# Altium schematic sheet Compute-Module-Sheet-2.SchDoc
size 420 x 297 mm; SheetNumber: 3; SheetTotal: 3
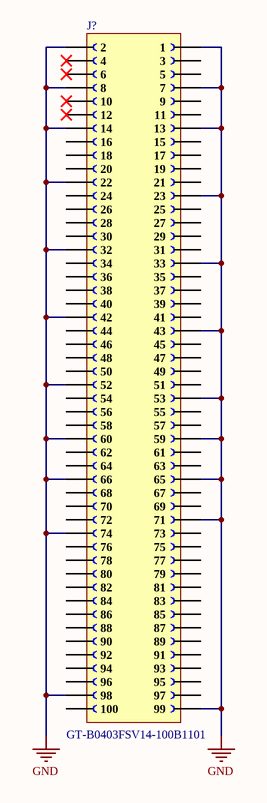
[diagram p0: Compute-Module-Sheet-2.SchDoc]

## Parts
J?  GT-B0403FSV14-100B1101  [GT-B0403FSV14-100B1101]

## Nets
GND: J?.1 J?.2 J?.7 J?.8 J?.13 J?.14 J?.22 J?.23 J?.32 J?.33 J?.42 J?.43 J?.52 J?.53 J?.59 J?.60 J?.65 J?.66 J?.71 J?.74 J?.98 J?.99

Not connected (* = marked no-connect by the designer): J? 3 4* 5 6* 9 10* 11 12* 15 16 17 18 19 20 21 24 25 26 27 28 29 30 31 34 35 36 37 38 39 40 41 44 45 46 47 48 49 50 51 54 55 56 57 58 61 62 63 64 67 68 69 70 72 73 75 76 77 78 79 80 81 82 83 84 85 86 87 88 89 90 91 92 93 94 95 96 97 100

## Notes on the sheet
- File:
- Title:
- Date:
- Page
- Num:
- Total:
- Drawn By: Huzaifa Ali

## Library data of the parts
J? = GT-B0403FSV14-100B1101: 0.4mm 2 100P -55℃~+125℃ Standing paste 0.3A SMD,P=0.4mm Board-to-Board and Backplane Connector ROHS; Manufacturer: G-Switch; Manufacturer Part Number: GT-B0403FSV14-100B1101; Package: SMD,P=0.4mm; LCSC Part Number: C42376244; Item Type: Connector; ComponentLink1Description: LCSC; ComponentLink1URL: https://www.lcsc.com/product-detail/Board-to-Board-and-Backplane-Connector_G-Switch-GT-B0403FSV14-100B1101_C42376244.html